# Altium schematic sheet EEPROM_memory.SchDoc: =DT_SCH_Title
size A4; Organization: Droid Technologies; SheetNumber: 6; SheetTotal: 18
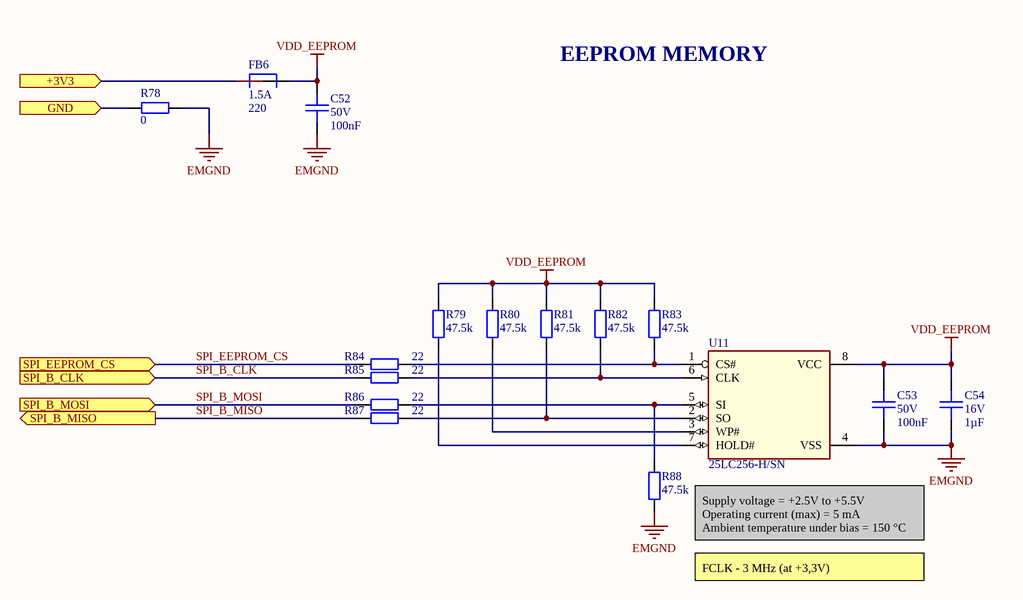
[diagram p0: EEPROM_memory.SchDoc]

## Parts
C52  Voltage Rating: 50V  Capacitance: 100nF  [CAPC100x50x50L25]  (hidden comment: GCM155L8EH104KE07D)
C53  Voltage Rating: 50V  Capacitance: 100nF  [CAPC100x50x50L25]  (hidden comment: GCM155L8EH104KE07D)
C54  Voltage Rating: 16V  Capacitance: 1µF  [CAPC160X80X90L35]  (hidden comment: GCG188L8EE105KA07D)
FB6  Imax: 1.5A  Impedance: 220  [BEADC160X80X95L40]  (hidden comment: BLM18KG221BH1D)
R78  Resistance: 0  [RESC160X80X55L30]  (hidden comment: RC0603FR-070RL)
R79  Resistance: 47.5k  [RESC100X50X40L25]  (hidden comment: RC0402FR-0747K5L)
R80  Resistance: 47.5k  [RESC100X50X40L25]  (hidden comment: RC0402FR-0747K5L)
R81  Resistance: 47.5k  [RESC100X50X40L25]  (hidden comment: RC0402FR-0747K5L)
R82  Resistance: 47.5k  [RESC100X50X40L25]  (hidden comment: RC0402FR-0747K5L)
R83  Resistance: 47.5k  [RESC100X50X40L25]  (hidden comment: RC0402FR-0747K5L)
R84  Resistance: 22  [RESC100X50X40L25]  (hidden comment: RC0402FR-0722RL)
R85  Resistance: 22  [RESC100X50X40L25]  (hidden comment: RC0402FR-0722RL)
R86  Resistance: 22  [RESC100X50X40L25]  (hidden comment: RC0402FR-0722RL)
R87  Resistance: 22  [RESC100X50X40L25]  (hidden comment: RC0402FR-0722RL)
R88  Resistance: 47.5k  [RESC100X50X40L25]  (hidden comment: RC0402FR-0747K5L)
U11  25LC256-H/SN  [SOIC8P127_490X600X175L70X41]

## Ports
+3V3 (in), GND (in), SPI_B_CLK (in), SPI_B_MISO (out), SPI_B_MOSI (in), SPI_EEPROM_CS (in)

## Nets
EMGND: C52.1 C53.1 C54.1 R78.1 R88.1 U11.4(VSS)
VDD_EEPROM: C52.2 C53.2 C54.2 FB6.2 R79.2 R80.2 R81.2 R82.2 R83.2 U11.8(VCC)
+3V3: FB6.1 ; port +3V3
GND: R78.2 ; port GND
SPI_B_CLK: R85.1 ; port SPI_B_CLK
SPI_B_MISO: R87.1 ; port SPI_B_MISO
SPI_B_MOSI: R86.1 ; port SPI_B_MOSI
SPI_EEPROM_CS: R84.1 ; port SPI_EEPROM_CS
NetR79_1: R79.1 U11.7(HOLD#)
NetR80_1: R80.1 U11.3(WP#)
NetR81_1: R81.1 R87.2 U11.2(SO)
NetR82_1: R82.1 R85.2 U11.6(CLK)
NetR83_1: R83.1 R84.2 U11.1(CS#)
NetR86_2: R86.2 R88.2 U11.5(SI)

## Notes on the sheet
- EEPROM MEMORY
- Supply voltage = +2.5V to +5.5V
  Operating current (max) = 5 mA
  Ambient temperature under bias = 150 °C
- FCLK - 3 MHz (at +3,3V)
- Title
- Size:
- A4
- Number:
- Revision:
- Date:
- Time:
- Sheet
- of

## Library data of the parts
C52 C53 = CMP-001-1980-2: CAP CER 0.1UF 50V X8L 0402; Manufacturer: Murata Electronics; Op Temp max: 150°C; Op Temp min: -55°C; Tolerance: 10%; Height max: 550µm; ComponentLink3Description: Digikey; Mounting Type: SM; ComponentLink3URL: https://www.digikey.com/en/products/detail/murata-electronics/GCM155L8EH104KE07D/11618823; Package: 0402 (1005 Metric); Lead Spacing: 0mm; MPN: GCM155L8EH104KE07D; Size: 1.00mm x 0.50mm; Ratings: AEC-Q200; ComponentLink1URL: https://www.murata.com/en-us/products/productdetail?partno=GCM155L8EH104KE07%23; ComponentLink1Description: Datasheet; Dielectric: X8L; ComponentLink2Description: Mouser; ComponentLink2URL: https://eu.mouser.com/ProductDetail/Murata-Electronics/GCM155L8EH104KE07D?qs=1mbolxNpo8fQSHf0HYnZWw%3D%3D
C54 = CMP-001-1982-2: CAP CER 1UF 16V X8L 0603; Manufacturer: Murata Electronics; Tolerance: 10%; Op Temp min: -55°C; Op Temp max: 150°C; ComponentLink3URL: https://www.digikey.com/en/products/detail/murata-electronics/GCG188L8EE105KA07D/10695125; Package: 0603 (1608 Metric); MPN: GCG188L8EE105KA07D; ComponentLink2URL: https://eu.mouser.com/ProductDetail/Murata-Electronics/GCG188L8EE105KA07D?qs=rrS6PyfT74dFMfTR80dVTA%3D%3D; Dielectric: X8L; Size: 1.60mm x 0.80mm; ComponentLink1Description: Datasheet; ComponentLink1URL: https://www.murata.com/en-us/products/productdetail?partno=GCG188L8EE105KA07%23; ComponentLink2Description: Mouser; Height max: 900µm; Mounting Type: SM; ComponentLink3Description: Digikey; Lead Spacing: 0mm; Ratings: AEC-Q200
FB6 = CMP-001-1981-1: FERRITE BEAD 220 OHM 0603 1LN; Manufacturer: Murata Electronics; DCR: 50m; Op Temp min: -55°C; Frequency: 100MHz; Op Temp max: 150°C; Number of Lines: 1; Mounting Type: SM; Size: 1.60mm x 0.80mm; ComponentLink2URL: https://eu.mouser.com/ProductDetail/Murata-Electronics/BLM18KG221BH1D?qs=sJ5gq5MLFXpgEHYBdWUtkQ%3D%3D; ComponentLink1Description: Datasheet; ComponentLink1URL: https://www.murata.com/en-us/products/productdata/8798137286686/QNFA9129.pdf; Lead Spacing: 0mm; Ratings: AEC-Q200; ComponentLink3Description: Digikey; ComponentLink3URL: https://www.digikey.com/en/products/detail/murata-electronics/BLM18KG221BH1D/6156000; Height max: 950µm; Package: 0603 (1608 Metric); ComponentLink2Description: Mouser; MPN: BLM18KG221BH1D
R78 = CMP-001-0927-2: RES 0 OHM JUMPER 1/10W 0603; Manufacturer: YAGEO; Op Temp min: -55°C; Op Temp max: 155°C; Power: 100mW; Tolerance: 0%; Height max: 550µm; ComponentLink2URL: https://eu.mouser.com/ProductDetail/YAGEO/RC0603FR-070RL?qs=0yPvnVz5%2FmpDQv43TwvCfw%3D%3D; Temperature Coefficient: -; ComponentLink3Description: Digikey; ComponentLink2Description: Mouser; MPN: RC0603FR-070RL; ComponentLink1URL: https://www.yageo.com/upload/media/product/productsearch/datasheet/rchip/PYu-RC_Group_51_RoHS_L_12.pdf; Ratings: -; Size: 1.60mm x 0.80mm; Composition: Thick Film; Mounting Type: SM; ComponentLink3URL: https://www.digikey.com/en/products/detail/yageo/RC0603FR-070RL/1304008; Package: 0603 (1608 Metric); ComponentLink1Description: Datasheet
R79-R83 R88 = CMP-001-0277-7: RES 47.5K OHM 1% 1/16W 0402; Manufacturer: YAGEO; Op Temp min: -55°C; Power: 63mW; Temperature Coefficient: ±100ppm; Op Temp max: 155°C; ComponentLink1URL: https://www.yageo.com/upload/media/product/productsearch/datasheet/rchip/PYu-RC_Group_51_RoHS_L_12.pdf; ComponentLink1Description: Datasheet; MPN: RC0402FR-0747K5L; ComponentLink3Description: Digikey; ComponentLink2URL: https://eu.mouser.com/ProductDetail/YAGEO/RC0402FR-0747K5L?qs=V1yeUXFNrklfu86Rfgihxg%3D%3D; Mounting Type: SM; Tolerance: 1%; Package: 0402 (1005 Metric); Height max: 400µm; ComponentLink2Description: Mouser; ComponentLink3URL: https://www.digikey.com/en/products/detail/yageo/RC0402FR-0747K5L/726617; Size: 1.00mm x 0.50mm; Composition: Thick Film; Ratings: -
R84-R87 = CMP-001-0482-4: RES 22 OHM 1% 1/16W 0402; Manufacturer: YAGEO; Temperature Coefficient: ±100ppm; Op Temp max: 155°C; Op Temp min: -55°C; Power: 63mW; Ratings: -; ComponentLink3URL: https://www.digikey.com/en/products/detail/yageo/RC0402FR-0722RL/726562; ComponentLink2URL: https://eu.mouser.com/ProductDetail/YAGEO/RC0402FR-0722RL?qs=V1yeUXFNrkkRg6zf08ADKQ%3D%3D; MPN: RC0402FR-0722RL; ComponentLink1Description: Datasheet; ComponentLink3Description: Digikey; Tolerance: 1%; Size: 1.00mm x 0.50mm; ComponentLink1URL: https://www.yageo.com/upload/media/product/productsearch/datasheet/rchip/PYu-RC_Group_51_RoHS_L_12.pdf; Composition: Thick Film; ComponentLink2Description: Mouser; Mounting Type: SM; Package: 0402 (1005 Metric); Height max: 400µm
U11 = 25LC256-H/SN: IC EEPROM 256KBIT SPI 5MHZ 8SOIC; Manufacturer: Microchip Technology; MPN: 25LC256-H/SN